# Altium project Light_SPT_Device_v1.1.PrjPcb (part 1 of 4)
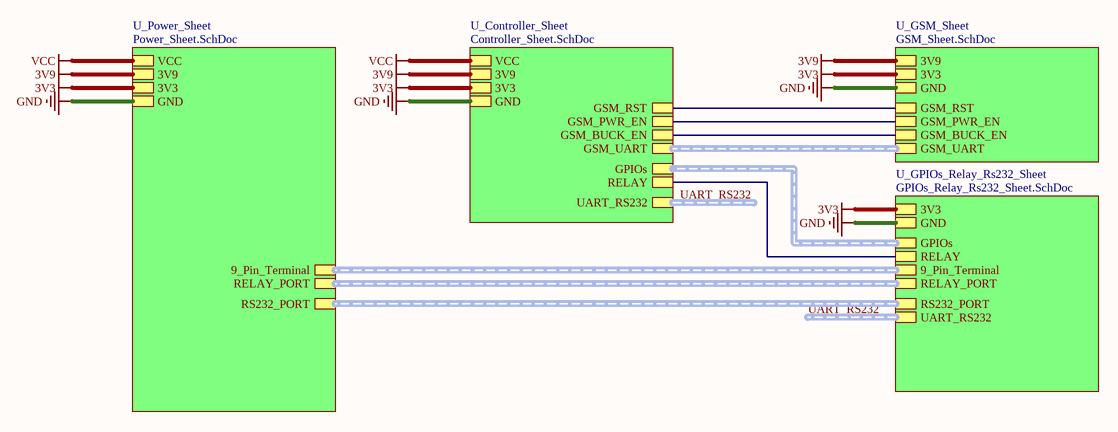
[diagram p0: Top_Sheet.SchDoc]
5 sheets, 156 parts. Net scope: hierarchical (ports join the sheet entries above them; power ports are global).
Board file: Light_SPT_Device_v1.0.PcbDoc
Sheets:
  Top_Sheet.SchDoc
    U_Power_Sheet = Power_Sheet.SchDoc
    U_Controller_Sheet = Controller_Sheet.SchDoc
    U_GSM_Sheet = GSM_Sheet.SchDoc
    U_GPIOs_Relay_Rs232_Sheet = GPIOs_Relay_Rs232_Sheet.SchDoc

## Sheet Top_Sheet.SchDoc
size A4; SheetNumber: 1; SheetTotal: 5

### Sub-sheets
U_Controller_Sheet = Controller_Sheet.SchDoc: GPIOs (harness GPIOs), RELAY, GSM_UART (harness GSM_UART), GSM_PWR_EN, GSM_RST, UART_RS232 (harness UART_RS232), GSM_BUCK_EN, GND, 3V3, 3V9, VCC
U_GPIOs_Relay_Rs232_Sheet = GPIOs_Relay_Rs232_Sheet.SchDoc: GPIOs (harness GPIOs), RELAY, RELAY_PORT (harness RELAY_PORT), GND, 3V3, 9_Pin_Terminal (harness 9_Pin_Terminal), RS232_PORT (harness RS232_PORT), UART_RS232 (harness UART_RS232)
U_GSM_Sheet = GSM_Sheet.SchDoc: GSM_UART (harness GSM_UART), GSM_PWR_EN, GSM_RST, GSM_BUCK_EN, GND, 3V3, 3V9
U_Power_Sheet = Power_Sheet.SchDoc: VCC, 3V9, GND, 3V3, RELAY_PORT (harness RELAY_PORT), RS232_PORT (harness RS232_PORT), 9_Pin_Terminal (harness RELAY_PORT)

### Nets
3V3: sheet U_Power_Sheet/3V3, sheet U_Controller_Sheet/3V3, sheet U_GSM_Sheet/3V3, sheet U_GPIOs_Relay_Rs232_Sheet/3V3
3V9: sheet U_Power_Sheet/3V9, sheet U_Controller_Sheet/3V9, sheet U_GSM_Sheet/3V9
GND: sheet U_Power_Sheet/GND, sheet U_Controller_Sheet/GND, sheet U_GSM_Sheet/GND, sheet U_GPIOs_Relay_Rs232_Sheet/GND
VCC: sheet U_Power_Sheet/VCC, sheet U_Controller_Sheet/VCC
GSM_BUCK_EN: sheet U_Controller_Sheet/GSM_BUCK_EN, sheet U_GSM_Sheet/GSM_BUCK_EN
GSM_PWR_EN: sheet U_Controller_Sheet/GSM_PWR_EN, sheet U_GSM_Sheet/GSM_PWR_EN
GSM_RST: sheet U_Controller_Sheet/GSM_RST, sheet U_GSM_Sheet/GSM_RST
RELAY: sheet U_Controller_Sheet/RELAY, sheet U_GPIOs_Relay_Rs232_Sheet/RELAY

### Buses and harness runs
harness sheet U_Controller_Sheet/GPIOs = sheet U_GPIOs_Relay_Rs232_Sheet/GPIOs
harness sheet U_Controller_Sheet/GSM_UART = sheet U_GSM_Sheet/GSM_UART
harness sheet U_GPIOs_Relay_Rs232_Sheet/9_Pin_Terminal = sheet U_Power_Sheet/9_Pin_Terminal
harness sheet U_GPIOs_Relay_Rs232_Sheet/RELAY_PORT = sheet U_Power_Sheet/RELAY_PORT
harness sheet U_GPIOs_Relay_Rs232_Sheet/RS232_PORT = sheet U_Power_Sheet/RS232_PORT
harness UART_RS232 = sheet U_Controller_Sheet/UART_RS232
harness UART_RS232 = sheet U_GPIOs_Relay_Rs232_Sheet/UART_RS232

### Notes on the sheet
- File:
- Title:
- Date:
- Page
- Num:
- Total:
- Drawn By: Huzaifa Ali

## Sheet Power_Sheet.SchDoc
size 420 x 297 mm; SheetNumber: 2; SheetTotal: 5
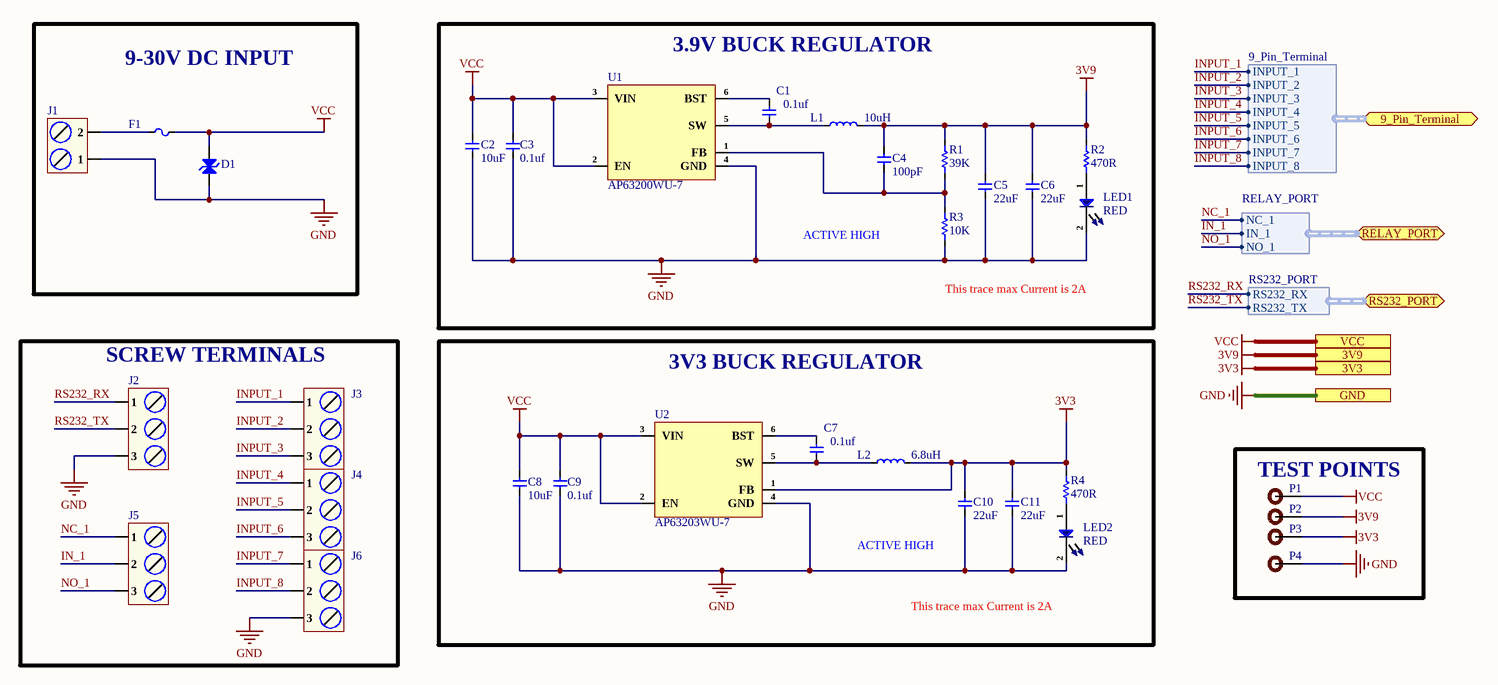
[diagram p1: Power_Sheet.SchDoc]

### Parts
C1  0.1uf  [Cap-0402]
C2  10uF  [Cap-0402]
C3  0.1uf  [Cap-0402]
C4  100pF  [Cap-0402]
C5  22uF  [Cap-1206]
C6  22uF  [Cap-1206]
C7  0.1uf  [Cap-0402]
C8  10uF  [Cap-0402]
C9  0.1uf  [Cap-0402]
C10  22uF  [Cap-1206]
C11  22uF  [Cap-1206]
D1  SMBJ36CA  [SMB_]  (value not drawn)
F1  BSMD1812-150-33V  [Fuse-1812_]  (value not drawn)
J1  DB128L-5.08-2P-BK-S  [DB128L-5.08-2P-BK-S]  (value not drawn)
J2  DB128L-5.08-3P-BK-S  [DB128L-5.08-3P-BK-S]  (value not drawn)
J3  DB128L-5.08-3P-BK-S  [DB128L-5.08-3P-BK-S]  (value not drawn)
J4  DB128L-5.08-3P-BK-S  [DB128L-5.08-3P-BK-S]  (value not drawn)
J5  DB128L-5.08-3P-BK-S  [DB128L-5.08-3P-BK-S]  (value not drawn)
J6  DB128L-5.08-3P-BK-S  [DB128L-5.08-3P-BK-S]  (value not drawn)
L1  10uH  [VLS5045EX-100M-H]
L2  6.8uH  [LVC505040-6R8M-N_]
LED1  RED  [LED-0603]
LED2  RED  [LED-0603]
P1  TEST POINT  [Test-point]  (value not drawn)
P2  TEST POINT  [Test-point]  (value not drawn)
P3  TEST POINT  [Test-point]  (value not drawn)
P4  TEST POINT  [Test-point]  (value not drawn)
R1  39K  [Res-0402]
R2  470R  [Res-0201]
R3  10K  [Res-0201]
R4  470R  [Res-0201]
U1  AP63200WU-7  [TSOT-26-6]
U2  AP63203WU-7  [TSOT-23-6]

### Blocks framed on the sheet
9-30V DC INPUT: D1 F1 J1
3.9V BUCK REGULATOR: C1-C6 L1 LED1 R1-R3 U1
SCREW TERMINALS: J2-J6
3V3 BUCK REGULATOR: C7-C11 L2 LED2 R4 U2
TEST POINTS: P1-P4

### Ports
3V3, 3V9, 9_Pin_Terminal (bidir, harness 9_Pin_Terminal), GND, RELAY_PORT (bidir, harness RELAY_PORT), RS232_PORT (bidir, harness RS232_PORT), VCC

### Harnesses
RELAY_PORT: NC_1, NO_1, IN_1
RS232_PORT: RS232_RX, RS232_TX
9_Pin_Terminal: INPUT_1, INPUT_2, INPUT_3, INPUT_4, INPUT_5, INPUT_6, INPUT_7, INPUT_8

### Nets
3V3: C10.2 C11.2 L2.2 P3.1 R4.2 U2.1(FB) ; port 3V3
3V9: C4.2 C5.2 C6.2 L1.2 P2.1 R1.2 R2.2 ; port 3V9
GND: C2.1 C3.1 C5.1 C6.1 C8.1 C9.1 C10.1 C11.1 D1.1(A) J1.1 J2.3 J6.3 LED1.2 LED2.2 P4.1 R3.1 U1.4(GND) U2.4(GND) ; port GND
VCC: C2.2 C3.2 C8.2 C9.2 D1.2(K) F1.2 P1.1 U1.2(EN) U1.3(VIN) U2.2(EN) U2.3(VIN) ; port VCC
IN_1: J5.2 ; port RELAY_PORT.IN_1
INPUT_1: J3.1 ; port 9_Pin_Terminal.INPUT_1
INPUT_2: J3.2 ; port 9_Pin_Terminal.INPUT_2
INPUT_3: J3.3 ; port 9_Pin_Terminal.INPUT_3
INPUT_4: J4.1 ; port 9_Pin_Terminal.INPUT_4
INPUT_5: J4.2 ; port 9_Pin_Terminal.INPUT_5
INPUT_6: J4.3 ; port 9_Pin_Terminal.INPUT_6
INPUT_7: J6.1 ; port 9_Pin_Terminal.INPUT_7
INPUT_8: J6.2 ; port 9_Pin_Terminal.INPUT_8
NC_1: J5.1 ; port RELAY_PORT.NC_1
NO_1: J5.3 ; port RELAY_PORT.NO_1
RS232_RX: J2.1 ; port RS232_PORT.RS232_RX
RS232_TX: J2.2 ; port RS232_PORT.RS232_TX
NetC1_1: C1.1 L1.1 U1.5(SW)
NetC1_2: C1.2 U1.6(BST)
NetC4_1: C4.1 R1.1 R3.2 U1.1(FB)
NetC7_1: C7.1 L2.1 U2.5(SW)
NetC7_2: C7.2 U2.6(BST)
NetF1_1: F1.1 J1.2
NetLED1_1: LED1.1 R2.1
NetLED2_1: LED2.1 R4.1

### Notes on the sheet
- ACTIVE HIGH
- This trace max Current is 2A
- (near C10) ACTIVE HIGH
- (near LED2) This trace max Current is 2A
- File:
- Title:
- Date:
- Page
- Num:
- Total:
- Drawn By: Huzaifa Ali

### Library data of the parts
C1 C3 C7 C9 = GRM155R62A104KE14D: CAP CER 0.1UF 100V X5R 0402; Manufacturer: Murata; Capacitance: 100nF; Tolerance: 10%; Item Type: Capacitor; Supplier 1: Arrow Electronics; Manufacturer Part Number: GRM155R62A104KE14D; RoHS: Yes; Category: Ceramic Capacitors; Stock 1: 870000; Pricing 1: 10000=0.00500, 20000=0.00410, 30000=0.00390, 50000=0.00370, 100000=0.00300 (USD); Mount: Surface Mount; Case/Package: 0402; Case Code (Metric): 1005; Case Code (Imperial): 0402; Weight: 0.000212oz; Min Operating Temperature: -55°C; Max Operating Temperature: 85°C; Packaging: Tape and Reel; Voltage Rating: 100V; Dielectric: X5R; Termination: SMD/SMT; Voltage Rating (DC): 100V; Package Quantity: 10000; Series: GRM; Length: 0.039inch; Width: 0.02inch; Height: 0.5mm; Thickness: 0.022inch; Reach SVHC Compliant: Yes; Lead Free: Lead Free; RoHS Compliant: Yes; ComponentLink1URL: http://www.farnell.com/datasheets/2079151.pdf?src-supplier=Farnell; ComponentLink1Description: http://www.farnell.com/datasheets/2079151.pdf?src-supplier=Farnell; ComponentLink2URL: http://www.mouser.com/ds/2/281/c02e-2905.pdf?src-supplier=Mouser; ComponentLink2Description: http://www.mouser.com/ds/2/281/c02e-2905.pdf?src-supplier=Mouser; ComponentLink3URL: http://www.farnell.com/datasheets/2079151.pdf?src-supplier=Element14; ComponentLink3Description: http://www.farnell.com/datasheets/2079151.pdf?src-supplier=Element14; ComponentLink4URL: http://search.murata.co.jp/Ceramy/image/img/A01X/G101/ENG/GRM155R62A104KE14-01.pdf?src-supplier=Digi-Key; ComponentLink4Description: http://search.murata.co.jp/Ceramy/image/img/A01X/G101/ENG/GRM155R62A104KE14-01.pdf?src-supplier=Digi-Key; ComponentLink5URL: http://www.farnell.com/datasheets/2079151.pdf?src-supplier=Newark; ComponentLink5Description: http://www.farnell.com/datasheets/2079151.pdf?src-supplier=Newark; Supplier Part Number 1: GRM155R62A104KE14D; LCSC Part Number: C162178
C2 C8 = CL05A106MP5NUNC: CAP CER 10UF 10V X5R 0402; Manufacturer: Samsung; Tolerance: 20%; Item Type: Capacitor; Supplier 1: Avnet; Manufacturer Part Number: CL05A106MP5NUNC; RoHS: Yes; Category: Ceramic Capacitors; Stock 1: 1729850; Pricing 1: 10000=0.02537 (USD); Mount: Surface Mount; Case/Package: 0402; Case Code (Metric): 1005; Case Code (Imperial): 0402; Contact Plating: Tin; Min Operating Temperature: -55°C; Max Operating Temperature: 85°C; Package Quantity: 1; Packaging: Tape and Reel; Capacitance: 10uF; Voltage Rating: 10V; Dielectric: X5R; Termination: Wraparound; Series: CL; Construction: Flat; Length: 1mm; Width: 0.02inch; Thickness: 0.028inch; Depth: 0.5mm; Radiation Hardening: No; Lead Free: Lead Free; RoHS Compliant: Yes; ComponentLink1URL: https://datasheet.ciiva.com/25721/cl05a106mp5nunc-25721584.pdf?src-supplier=Digi-Key; ComponentLink1Description: https://datasheet.ciiva.com/25721/cl05a106mp5nunc-25721584.pdf?src-supplier=Digi-Key; ComponentLink2URL: https://datasheet.ciiva.com/26838/getdatasheetpartid-745310-26838170.pdf?src-supplier=Verical; ComponentLink2Description: https://datasheet.ciiva.com/26838/getdatasheetpartid-745310-26838170.pdf?src-supplier=Verical; Supplier Part Number 1: CL05A106MP5NUNC; LCSC Part Number: C315248
C4 = GRM1555C1H101JA01D: CAP CER 100PF 50V C0G/NP0 0402; Manufacturer: Murata; Material: Ceramic; Dielectric: C0G; Tolerance: 5%; Supplier 1: Mouser; Manufacturer Part Number: GRM1555C1H101JA01D; RoHS: Yes; Category: Ceramic Capacitors; Stock 1: 2073105; Pricing 1: 1=0.10000, 10=0.01000, 50=0.01000, 100=0.00900, 500=0.00600, 1000=0.00500, 2500=0.00400, 10000=0.00300, 50000=0.00200 (USD); Mount: Surface Mount; Case/Package: 0402; Case Code (Metric): 1005; Case Code (Imperial): 0402; Min Operating Temperature: -55°C; Max Operating Temperature: 125°C; Voltage Rating: 50V; Capacitance: 100pF; Packaging: Tape and Reel; Package Quantity: 1; Voltage Rating (DC): 50V; Termination: SMD/SMT; Series: GRM; Construction: Flat; Voltage: 50V; Length: 1mm; Width: 0.02inch; Height: 0.5mm; Thickness: 0.022inch; Depth: 0.5mm; Radiation Hardening: No; REACH SVHC: No SVHC; Lead Free: Lead Free; RoHS Compliant: Yes; ComponentLink1URL: https://datasheet.ciiva.com/11786/0900766b80ef921d-11786069.pdf?src-supplier=RSComponents; ComponentLink1Description: https://datasheet.ciiva.com/11786/0900766b80ef921d-11786069.pdf?src-supplier=RSComponents; ComponentLink2URL: https://datasheet.ciiva.com/18184/getdatasheetpartid-199957-18184175.pdf?src-supplier=Verical; ComponentLink2Description: https://datasheet.ciiva.com/18184/getdatasheetpartid-199957-18184175.pdf?src-supplier=Verical; ComponentLink3URL: https://datasheet.ciiva.com/29200/453557-da-01-en-vs-kondensator-0402-29200111.pdf?src-supplier=Conrad; ComponentLink3Description: https://datasheet.ciiva.com/29200/453557-da-01-en-vs-kondensator-0402-29200111.pdf?src-supplier=Conrad; ComponentLink4URL: https://datasheet.ciiva.com/6271/partnumbering-e-01-6271071.pdf?src-supplier=Digi-Key; ComponentLink4Description: https://datasheet.ciiva.com/6271/partnumbering-e-01-6271071.pdf?src-supplier=Digi-Key; ComponentLink5URL: https://datasheet.ciiva.com/16440/product-16440566.pdf?src-supplier=Future+Electronics; ComponentLink5Description: https://datasheet.ciiva.com/16440/product-16440566.pdf?src-supplier=Future+Electronics; Supplier Part Number 1: 81-GRM1555C1H101JA1D; LCSC Part Number: C77177
C5 C6 C10 C11 = 12063D226KAT2A: CAP CER 22UF 25V X5R 1206; Manufacturer: Kyocera AVX; Tolerance: 10%; Item Type: Capacitor; Supplier 1: Digi-Key; Manufacturer Part Number: 12063D226KAT2A; Stock 1: 135583; Pricing 1: 1=1.18, 10=0.895, 50=0.7434, 100=0.6401, 500=0.49556, 1000=0.42673 (USD); Mount: Surface Mount; Case/Package: 1206; Case Code (Imperial): 1206; Case Code (Metric): 3216; Min Operating Temperature: -55°C; Max Operating Temperature: 85°C; Package Quantity: 2500; Voltage Rating: 25V; Voltage Rating (DC): 25V; Packaging: Tape and Reel; Capacitance: 22uF; Dielectric: X5R; Termination: SMD/SMT; Series: -; Length: 3.2mm; Width: 0.063inch; Height: 0.07mm; Thickness: 0.071inch; Depth: 1.6mm; Lead Free: Lead Free; RoHS Compliant: Yes; ComponentLink1URL: http://www.avx.com/docs/Catalogs/cx5r.pdf?src-supplier=Future+Electronics; ComponentLink1Description: http://www.avx.com/docs/Catalogs/cx5r.pdf?src-supplier=Future+Electronics; Supplier Part Number 1: 478-9946-1-ND; LCSC Part Number: C2167862
D1 = SMBJ36CA: 58.1V 40V 36V Bi-Directional SMB(DO-214AA) TVS ROHS; Manufacturer: Slkor(SLKORMICRO Elec.); Item Type: Diode; Manufacturer Part Number: SMBJ36CA; Package: SMB(DO-214AA); LCSC Part Number: C556189; ComponentLink1Description: LCSC; ComponentLink1URL: https://www.lcsc.com/product-detail/span-style-background-color-ff0-TVS-span_Slkor-SLKORMICRO-Elec-SMBJ36CA_C556189.html
F1 = BSMD1812-150-33V: 33V 1.5A 40A 3A 1812 Resettable Fuses ROHS; Manufacturer: BHFUSE; Item Type: Fuse; Manufacturer Part Number: BSMD1812-150-33V; Package: 1812; LCSC Part Number: C883154; ComponentLink1Description: LCSC; ComponentLink1URL: https://www.lcsc.com/product-detail/Resettable-Fuses_BHFUSE-BSMD1812-150-33V_C883154.html
J1 = DB128L-5.08-2P-BK-S: 1x2P 18A -40℃~+105℃ 250V Black 12~30 Straight pin 5.08mm 2.5 1 2 Plugin,P=5.08mm Screw terminal ROHS; Manufacturer: DIBO; Item Type: Terminal Block; Manufacturer Part Number: DB128L-5.08-2P-BK-S; Package: Plugin,P=5.08mm; LCSC Part Number: C430601; ComponentLink1Description: LCSC; ComponentLink1URL: https://www.lcsc.com/product-detail/Screw-terminal_span-style-background-color-ff0-DIBO-span-DB128L-5-08-2P-BK-S_C430601.html
J2-J6 = DB128L-5.08-3P-BK-S: 1x3P 18A -40℃~+105℃ 250V Black 12~30 Straight pin 5.08mm 2.5 1 3 Plugin,P=5.08mm Screw terminal ROHS; Manufacturer: DIBO; Item Type: Terminal Block; Manufacturer Part Number: DB128L-5.08-3P-BK-S; Package: Plugin,P=5.08mm; LCSC Part Number: C430602; ComponentLink1Description: LCSC; ComponentLink1URL: https://www.lcsc.com/product-detail/Screw-terminal_DIBO-DB128L-5-08-3P-BK-S_C430602.html
L1 = VLS5045EX-100M-H: FIXED IND 10UH 2.5A 79.3MOHM SMD; Manufacturer: TDK; Item Type: Inductor; Supplier: Rs; Supplier Part Number: 2119532P; Manufacturer Part Number: VLS5045EX-100M-H; RoHS: Yes; Category: Fixed Inductors; Stock: 650; Pricing: 100=0.239, 250=0.211, 500=0.197, 1000=0.183 (GBP); LCSC Part Number: C1845361; ComponentLink1Description: LCSC; ComponentLink1URL: https://www.lcsc.com/product-detail/Power-Inductors_TDK-VLS5045EX-100M-H_C1845361.html
L2 = LVC505040-6R8M-N: 2.7A 6.8uH ±20% 50mΩ SMD Power Inductors ROHS; Manufacturer: Chlisin Elec; ComponentLink1Description: LCSC; ComponentLink1URL: https://www.lcsc.com/product-detail/Power-Inductors_Chilisin-Elec-LVC505040-6R8M-N_C285870.html; Manufacturer Part Number: LVC505040-6R8M-N; Value: 6.8uH; Footprint: Custom; LCSC Part Number: C285870; Item Type: Inductor
LED1 LED2 = 19-21/R7C-AK1L2BY/3T: Red 632nm LED Indication - Discrete 2.05V 0603 (1608 Metric); Manufacturer: Everlight Elec; Manufacturer Part Number: 19-21/R7C-AK1L2BY/3T; Package: 0603; LCSC Part Number: C1322287; Item Type: LED; ComponentLink1Description: LCSC; ComponentLink1URL: https://www.lcsc.com/product-detail/Light-Emitting-Diodes-LED_Everlight-Elec-19-21-R7C-AK1L2BY-3T_C1322287.html
P1-P4 = TEST POINT: Test Point ON
R1 = RC0402FR-0739KL: RES 39K OHM 1% 1/16W 0402; Manufacturer: Yageo; Voltage Rating: 50V; Resistance: 39kR; Power Rating: 63mW; Temperature Coefficient: 100ppm/°C; Supplier 1: Mouser; Manufacturer Part Number: RC0402FR-0739KL; RoHS: Yes; Category: Chip SMD Resistors; Stock 1: 177055; Pricing 1: 1=0.10000, 10=0.01200, 50=0.01200, 100=0.00500, 1000=0.00300, 2500=0.00200, 10000=0.00100 (USD); Case/Package: 0402; Case Code (Metric): 1005; Case Code (Imperial): 0402; Size Code: 0402; Min Operating Temperature: -55°C; Max Operating Temperature: 155°C; Packaging: Tape and Reel; Tolerance: 1%; Package Quantity: 1; Resistor Type: Thick Film; Number of Terminations: 2; Termination: SMD/SMT; Max Power Dissipation: 63mW; Features: Moisture Resistant; Series: RC; Resistance Tolerance: 1%; Construction: Rectangular; Technology: THICK FILM; Length: 1mm; Width: 0.02inch; Height: 0.016inch; Depth: 0.5mm; RoHS Compliant: Yes; REACH SVHC: Unknown; Military Standard: Not; Lead Free: Lead Free; ComponentLink1URL: https://datasheet.ciiva.com/11819/0900766b80c66297-11819480.pdf?src-supplier=RSComponents; ComponentLink1Description: https://datasheet.ciiva.com/11819/0900766b80c66297-11819480.pdf?src-supplier=RSComponents; ComponentLink2URL: https://datasheet.ciiva.com/2553/pyu-r-int-thick-7-2553207.pdf?src-supplier=Digi-Key; ComponentLink2Description: https://datasheet.ciiva.com/2553/pyu-r-int-thick-7-2553207.pdf?src-supplier=Digi-Key; ComponentLink3URL: https://datasheet.ciiva.com/2553/pyu-r-int-thick-7-2553208.pdf?src-supplier=Digi-Key; ComponentLink3Description: https://datasheet.ciiva.com/2553/pyu-r-int-thick-7-2553208.pdf?src-supplier=Digi-Key; ComponentLink4URL: https://datasheet.ciiva.com/2553/pyu-r-int-thick-7-2553206.pdf?src-supplier=Digi-Key; ComponentLink4Description: https://datasheet.ciiva.com/2553/pyu-r-int-thick-7-2553206.pdf?src-supplier=Digi-Key; ComponentLink5URL: https://datasheet.ciiva.com/12668/pyu-rc0402-51-rohs-l-6-r-12668186.pdf?src-supplier=Mouser; ComponentLink5Description: https://datasheet.ciiva.com/12668/pyu-rc0402-51-rohs-l-6-r-12668186.pdf?src-supplier=Mouser; ComponentLink6URL: https://datasheet.ciiva.com/7849/1018594-7849980.pdf?src-supplier=Element14; ComponentLink6Description: https://datasheet.ciiva.com/7849/1018594-7849980.pdf?src-supplier=Element14; ComponentLink7URL: https://datasheet.ciiva.com/7849/1018594-7849981.pdf?src-supplier=Element14; ComponentLink7Description: https://datasheet.ciiva.com/7849/1018594-7849981.pdf?src-supplier=Element14; ComponentLink8URL: https://datasheet.ciiva.com/16941/pyu-rc0402-51-rohs-l-6-r-16941400.pdf?src-supplier=Future+Electronics; ComponentLink8Description: https://datasheet.ciiva.com/16941/pyu-rc0402-51-rohs-l-6-r-16941400.pdf?src-supplier=Future+Electronics; Supplier Part Number 1: 603-RC0402FR-0739KL; LCSC Part Number: C137995
R2 R4 = RC0201JR-07470RL: RES 470 OHM 5% 1/20W 0201; Manufacturer: Yageo; Temperature Coefficient: 200ppm/°C; Voltage Rating (DC): 25V; Max Power Dissipation: 50mW; Supplier 1: Digi-Key; Manufacturer Part Number: RC0201JR-07470RL; RoHS: Yes; Category: Chip SMD Resistors; Stock 1: 173754; Pricing 1: 1=0.10000, 10=0.02600, 100=0.01040, 1000=0.00466, 2500=0.00405, 5000=0.00334 (USD); Case/Package: 0201; Number of Pins: 2; Contact Plating: Tin,Matte; Case Code (Metric): 0603; Case Code (Imperial): 0201; Min Operating Temperature: -55°C; Max Operating Temperature: 125°C; Resistor Type: Thick Film; Tolerance: 5%; Resistance: 470R; Number of Terminations: 2; Termination: SMD/SMT; Features: Moisture Resistant; Power Rating: 50mW; Voltage Rating: 25V; Package Quantity: 1; Packaging: Tape and Reel; Length: 0.6mm; Width: 0.3mm; Height: 0.01inch; Depth: 0.3mm; Radiation Hardening: No; Military Standard: Not; Lead Free: Lead Free; REACH SVHC: No SVHC; ComponentLink1URL: https://datasheet.ciiva.com/5924/443682-5924928.pdf?src-supplier=Farnell; ComponentLink1Description: https://datasheet.ciiva.com/5924/443682-5924928.pdf?src-supplier=Farnell; ComponentLink2URL: https://datasheet.ciiva.com/8885/pyu-rc0201-51-rohs-l-8-8885600.pdf?src-supplier=Avnet; ComponentLink2Description: https://datasheet.ciiva.com/8885/pyu-rc0201-51-rohs-l-8-8885600.pdf?src-supplier=Avnet; ComponentLink3URL: https://datasheet.ciiva.com/28390/pyu-rc0201-51-rohs-l-8-28390376.pdf?src-supplier=Avnet+Europe; ComponentLink3Description: https://datasheet.ciiva.com/28390/pyu-rc0201-51-rohs-l-8-28390376.pdf?src-supplier=Avnet+Europe; ComponentLink4URL: https://datasheet.ciiva.com/8885/pyu-rc0201-51-rohs-l-8-8885642.pdf?src-supplier=Avnet; ComponentLink4Description: https://datasheet.ciiva.com/8885/pyu-rc0201-51-rohs-l-8-8885642.pdf?src-supplier=Avnet; ComponentLink5URL: https://datasheet.ciiva.com/2462/pyu-r-int-thick-7-2462802.pdf?src-supplier=Digi-Key; ComponentLink5Description: https://datasheet.ciiva.com/2462/pyu-r-int-thick-7-2462802.pdf?src-supplier=Digi-Key; ComponentLink6URL: https://datasheet.ciiva.com/2462/pyu-r-int-thick-7-2462803.pdf?src-supplier=Digi-Key; ComponentLink6Description: https://datasheet.ciiva.com/2462/pyu-r-int-thick-7-2462803.pdf?src-supplier=Digi-Key; ComponentLink7URL: https://datasheet.ciiva.com/2462/pyu-r-int-thick-7-2462804.pdf?src-supplier=Digi-Key; ComponentLink7Description: https://datasheet.ciiva.com/2462/pyu-r-int-thick-7-2462804.pdf?src-supplier=Digi-Key; Supplier Part Number 1: 311-470NCT-ND; LCSC Part Number: C163491
R3 = RC0201FR-0710KL: RES SMD 10K OHM 1% 1/20W 0201; Manufacturer: Yageo; Item Type: Resistor; Manufacturer Part Number: RC0201FR-0710KL; Package: 0201; ComponentLink7Description: LCSC; ComponentLink7URL: https://www.lcsc.com/product-detail/Chip-Resistor-Surface-Mount_YAGEO-RC0201FR-0710KL_C106225.html; LCSC Part Number: C106225
U1 = AP63200WU-7: IC REG BUCK ADJUSTABLE 2A TSOT26; Manufacturer: Diodes; Supplier: Future Electronics; Supplier Part Number: 1108623; Manufacturer Part Number: AP63200WU-7; RoHS: Yes; Category: Voltage Regulators - Switching; Stock: 70; Pricing: 1=0.425, 15=0.385, 75=0.36, 300=0.345, 1500=0.315 (USD); ComponentLink1URL: https://www.diodes.com/assets/Datasheets/AP63200-AP63201-AP63203-AP63205.pdf?src-supplier=Digi-Key; ComponentLink1Description: https://www.diodes.com/assets/Datasheets/AP63200-AP63201-AP63203-AP63205.pdf?src-supplier=Digi-Key; LCSC Part Number: C2071868; Item Type: IC
U2 = AP63203WU-7: IC REG BUCK 3.3V 2A TSOT26; Manufacturer: Diodes; Supplier: Future Electronics; Supplier Part Number: 6109504; Manufacturer Part Number: AP63203WU-7; RoHS: Yes; Category: Voltage Regulators - Switching; Stock: 3000; Pricing: 3000=0.34, 6000=0.335, 9000=0.33, 12000=0.33, 15000=0.32 (USD); ComponentLink1URL: https://www.diodes.com/assets/Datasheets/AP63200-AP63201-AP63203-AP63205.pdf?src-supplier=Digi-Key; ComponentLink1Description: https://www.diodes.com/assets/Datasheets/AP63200-AP63201-AP63203-AP63205.pdf?src-supplier=Digi-Key; LCSC Part Number: C780769; Item Type: IC